# Altium schematic sheet 1.DSP.SchDoc
size A3; Date: 21/11/16; Author: DaiJun; Revision: 2.0; SheetNumber: 1; SheetTotal: 4; Size: A4; Contact: 0731-88731029
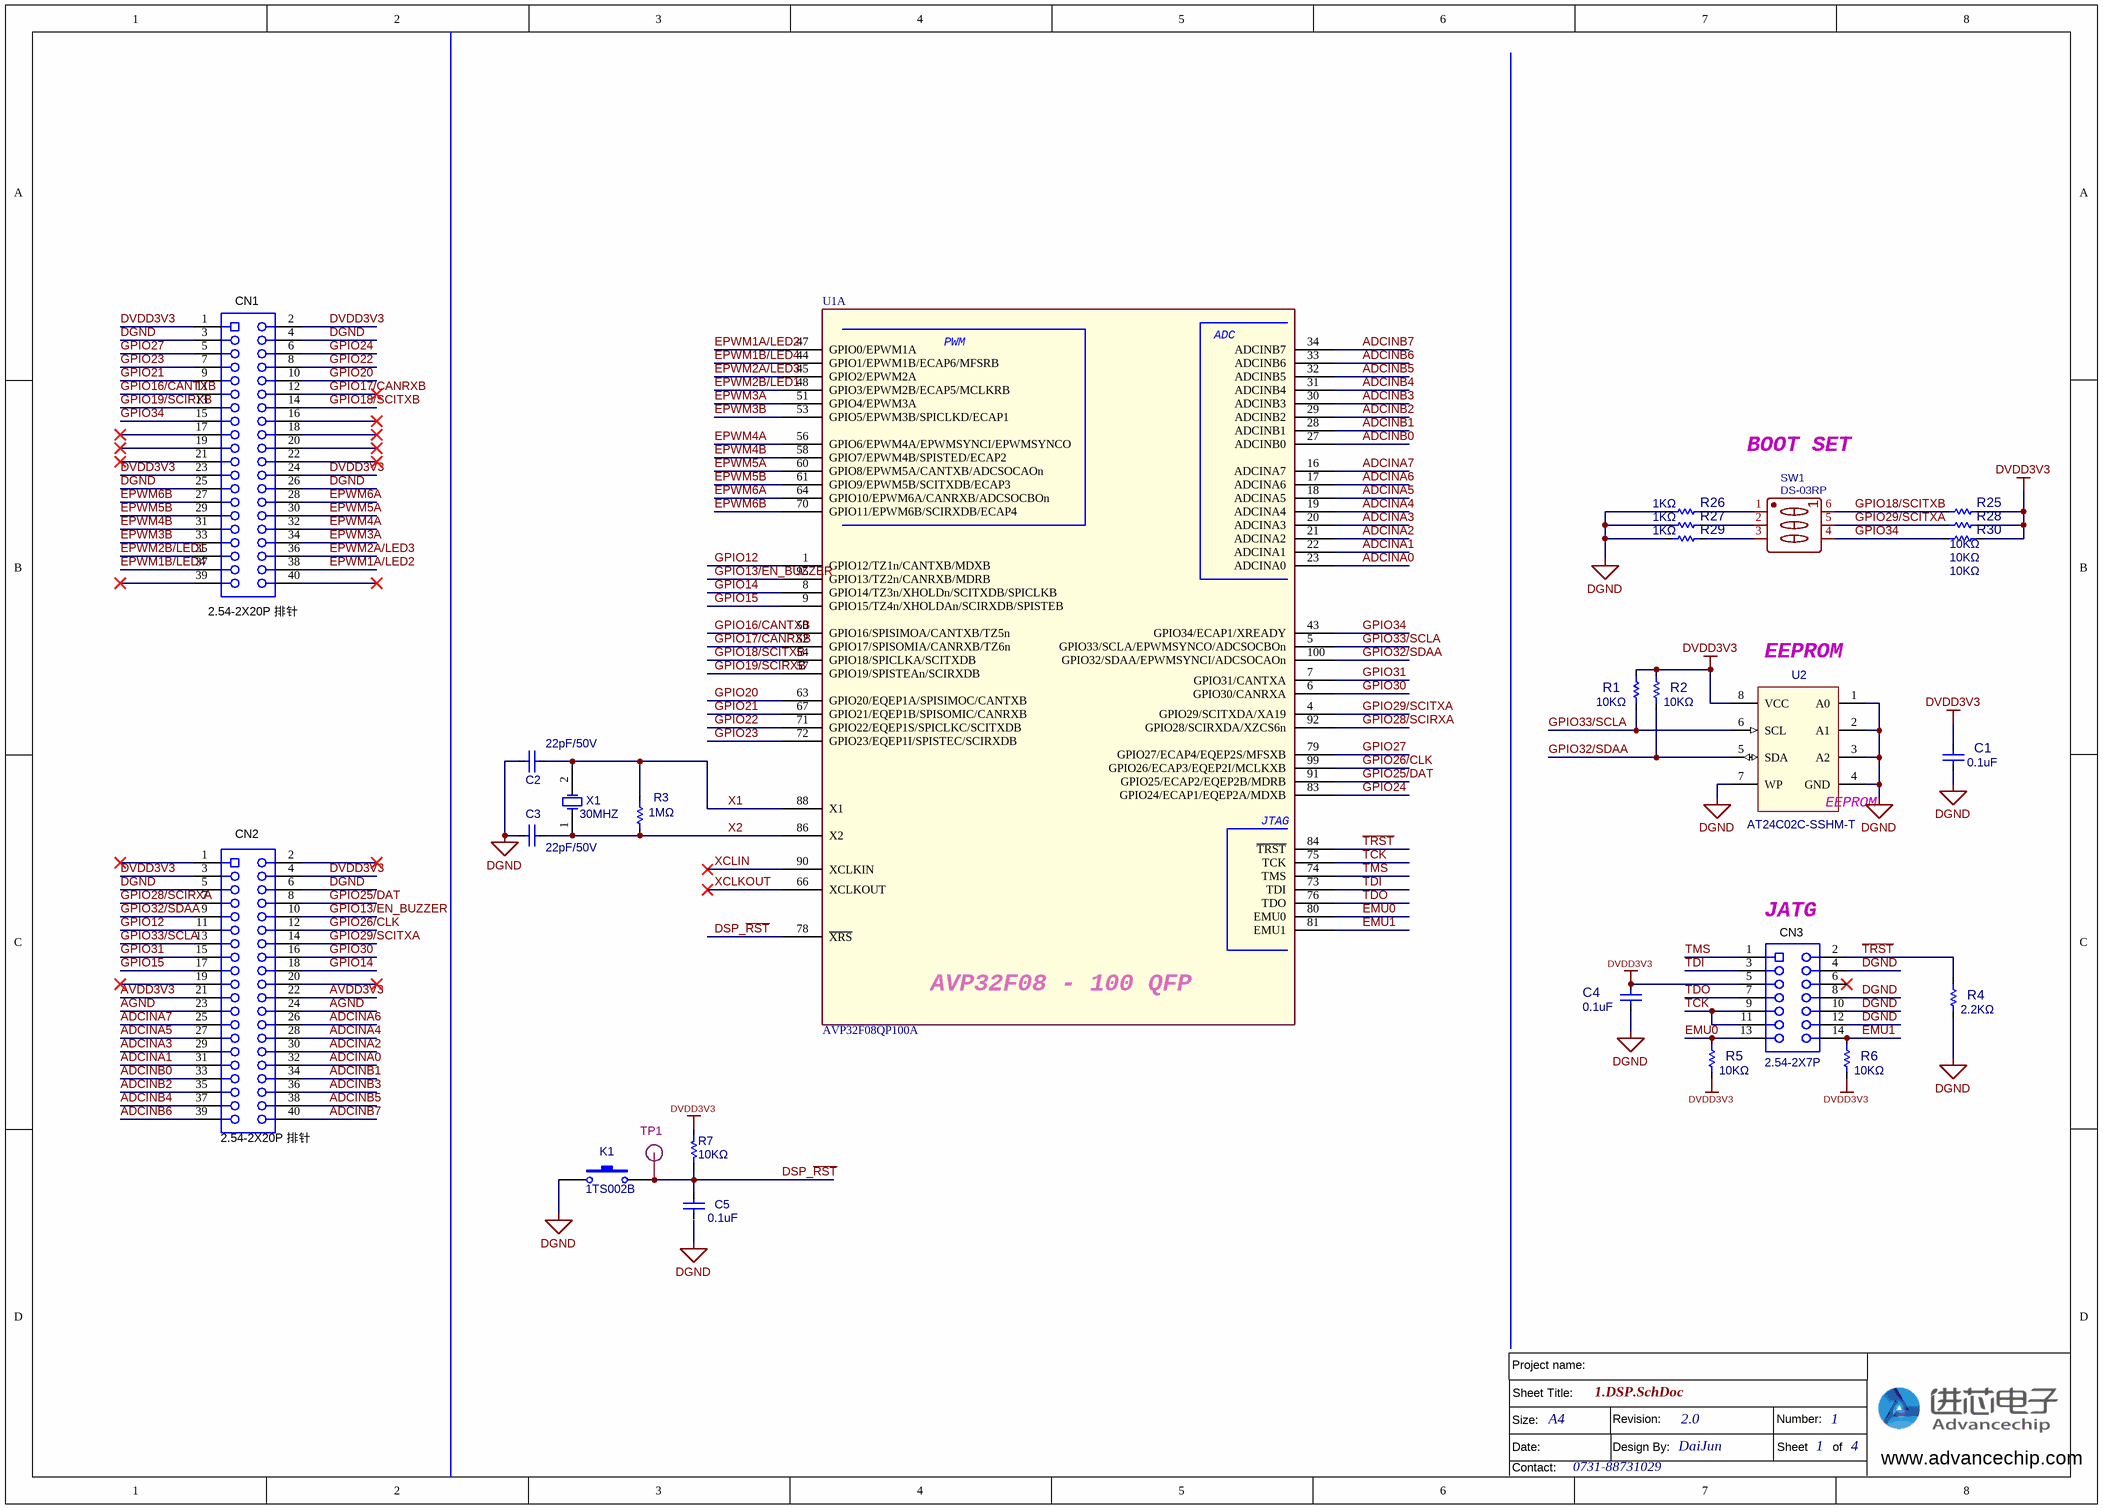
[diagram p0: 1.DSP.SchDoc]

## Parts
C1  value 0.1uF  [0603CX]  (hidden comment: 0.1uF/50V)
C2  22pF/50V  [0603cx]
C3  22pF/50V  [0603CX]
C4  value 0.1uF  [0603CX]  (hidden comment: 0.1uF/50V)
C5  value 0.1uF  [C0603]  (hidden comment: 0.1uF/50V)
CN1  2.54-2X20P 排针  [IDC2X20]
CN2  2.54-2X20P 排针  [IDC2X20]
CN3  value 2.54-2X7P  [IDC14-L]  (hidden comment: 2.54-2X7P 简易牛角母座)
K1  value 1TS002B  [SW-3X6]  (hidden comment: 1TS002B-2400-5001-CT)
R1  10KΩ  [0603RX]
R2  10KΩ  [0603RX]
R3  1MΩ  [0603RX]
R4  2.2KΩ  [0603RX]
R5  10KΩ  [0603RX]
R6  10KΩ  [0603RX]
R7  10KΩ  [R0603]
R25  10KΩ  [0603RX]
R26  1KΩ  [0603RX]
R27  1KΩ  [0603RX]
R28  10KΩ  [0603RX]
R29  1KΩ  [0603RX]
R30  10KΩ  [0603RX]
SW1  DS-03RP  [DS-03RP]
TP1  RST  [TEST-0.8/1.5MM]  (value not drawn)
U1  AVP32F08QP100A  [LQFP-100]  (part A of 2)
U2  AT24C02C-SSHM-T  [SO-8]
X1  value 30MHZ  [XTAL_5032]  (hidden comment: X503230MSB2GI)

## Nets
DGND: C1.2 C2.2 C3.1 C4.2 CN1.3 CN1.4 CN1.25 CN1.26 CN2.5 CN2.6 CN3.4 CN3.8 CN3.10 CN3.12 K1.2 R4.1 R26.2 R27.2 R29.2 U2.1(A0) U2.2(A1) U2.3(A2) U2.4(GND) U2.7(WP)
DVDD3V3: C1.1 C4.1 CN1.1 CN1.2 CN1.23 CN1.24 CN2.3 CN2.4 CN3.5 R1.2 R2.2 R5.1 R6.1 R7.1 R25.1 R28.1 R30.1 U2.8(VCC)
ADCINA0: CN2.32 U1.23(ADCINA0)
ADCINA1: CN2.31 U1.22(ADCINA1)
ADCINA2: CN2.30 U1.21(ADCINA2)
ADCINA3: CN2.29 U1.20(ADCINA3)
ADCINA4: CN2.28 U1.19(ADCINA4)
ADCINA5: CN2.27 U1.18(ADCINA5)
ADCINA6: CN2.26 U1.17(ADCINA6)
ADCINA7: CN2.25 U1.16(ADCINA7)
ADCINB0: CN2.33 U1.27(ADCINB0)
ADCINB1: CN2.34 U1.28(ADCINB1)
ADCINB2: CN2.35 U1.29(ADCINB2)
ADCINB3: CN2.36 U1.30(ADCINB3)
ADCINB4: CN2.37 U1.31(ADCINB4)
ADCINB5: CN2.38 U1.32(ADCINB5)
ADCINB6: CN2.39 U1.33(ADCINB6)
ADCINB7: CN2.40 U1.34(ADCINB7)
AGND: CN2.23 CN2.24
AVDD3V3: CN2.21 CN2.22
DSP_~{RST}: C5.1 K1.1 R7.2 TP1.1 U1.78(~{XRS})
EMU0: CN3.13 R5.2 U1.80(EMU0)
EMU1: CN3.14 R6.2 U1.81(EMU1)
EPWM1A/LED2: CN1.38 U1.47(GPIO0/EPWM1A)
EPWM1B/LED4: CN1.37 U1.44(GPIO1/EPWM1B/ECAP6/MFSRB)
EPWM2A/LED3: CN1.36 U1.45(GPIO2/EPWM2A)
EPWM2B/LED1: CN1.35 U1.48(GPIO3/EPWM2B/ECAP5/MCLKRB)
EPWM3A: CN1.34 U1.51(GPIO4/EPWM3A)
EPWM3B: CN1.33 U1.53(GPIO5/EPWM3B/SPICLKD/ECAP1)
EPWM4A: CN1.32 U1.56(GPIO6/EPWM4A/EPWMSYNCI/EPWMSYNCO)
EPWM4B: CN1.31 U1.58(GPIO7/EPWM4B/SPISTED/ECAP2)
EPWM5A: CN1.30 U1.60(GPIO8/EPWM5A/CANTXB/ADCSOCAOn)
EPWM5B: CN1.29 U1.61(GPIO9/EPWM5B/SCITXDB/ECAP3)
EPWM6A: CN1.28 U1.64(GPIO10/EPWM6A/CANRXB/ADCSOCBOn)
EPWM6B: CN1.27 U1.70(GPIO11/EPWM6B/SCIRXDB/ECAP4)
GPIO12: CN2.11 U1.1(GPIO12/TZ1n/CANTXB/MDXB)
GPIO13/EN_BUZZER: CN2.10 U1.95(GPIO13/TZ2n/CANRXB/MDRB)
GPIO14: CN2.18 U1.8(GPIO14/TZ3n/XHOLDn/SCITXDB/SPICLKB)
GPIO15: CN2.17 U1.9(GPIO15/TZ4n/XHOLDAn/SCIRXDB/SPISTEB)
GPIO16/CANTXB: CN1.11 U1.50(GPIO16/SPISIMOA/CANTXB/TZ5n)
GPIO17/CANRXB: CN1.12 U1.52(GPIO17/SPISOMIA/CANRXB/TZ6n)
GPIO18/SCITXB: CN1.14 R25.2 SW1.6(PIN6) U1.54(GPIO18/SPICLKA/SCITXDB)
GPIO19/SCIRXB: CN1.13 U1.57(GPIO19/SPISTEAn/SCIRXDB)
GPIO20: CN1.10 U1.63(GPIO20/EQEP1A/SPISIMOC/CANTXB)
GPIO21: CN1.9 U1.67(GPIO21/EQEP1B/SPISOMIC/CANRXB)
GPIO22: CN1.8 U1.71(GPIO22/EQEP1S/SPICLKC/SCITXDB)
GPIO23: CN1.7 U1.72(GPIO23/EQEP1I/SPISTEC/SCIRXDB)
GPIO24: CN1.6 U1.83(GPIO24/ECAP1/EQEP2A/MDXB)
GPIO25/DAT: CN2.8 U1.91(GPIO25/ECAP2/EQEP2B/MDRB)
GPIO26/CLK: CN2.12 U1.99(GPIO26/ECAP3/EQEP2I/MCLKXB)
GPIO27: CN1.5 U1.79(GPIO27/ECAP4/EQEP2S/MFSXB)
GPIO28/SCIRXA: CN2.7 U1.92(GPIO28/SCIRXDA/XZCS6n)
GPIO29/SCITXA: CN2.14 R28.2 SW1.5(PIN5) U1.4(GPIO29/SCITXDA/XA19)
GPIO30: CN2.16 U1.6(GPIO30/CANRXA)
GPIO31: CN2.15 U1.7(GPIO31/CANTXA)
GPIO32/SDAA: CN2.9 R2.1 U1.100(GPIO32/SDAA/EPWMSYNCI/ADCSOCAOn) U2.5(SDA)
GPIO33/SCLA: CN2.13 R1.1 U1.5(GPIO33/SCLA/EPWMSYNCO/ADCSOCBOn) U2.6(SCL)
GPIO34: CN1.15 R30.2 SW1.4(PIN4) U1.43(GPIO34/ECAP1/XREADY)
~{TRST}: CN3.2 R4.2 U1.84(~{TRST})
TCK: CN3.9 CN3.11 U1.75(TCK)
TDI: CN3.3 U1.73(TDI)
TDO: CN3.7 U1.76(TDO)
TMS: CN3.1 U1.74(TMS)
X1: C2.1 R3.1 U1.88(X1) X1.2(OSC2)
X2: C3.2 R3.2 U1.86(X2) X1.1(OSC1)
XCLIN: U1.90(XCLKIN)
XCLKOUT: U1.66(XCLKOUT)
NetR26_1: R26.1 SW1.1(PIN1)
NetR27_1: R27.1 SW1.2(PIN2)
NetR29_1: R29.1 SW1.3(PIN3)

Not connected (* = marked no-connect by the designer): C5 2; CN1 16* 17* 18* 19* 20* 21* 22* 39* 40*; CN2 1* 2* 19* 20*; CN3 6*

## Notes on the sheet
- BOOT SET
- (near U2) EEPROM
- (near CN3) JATG
- Sheet Title:
- Project name:
- Size:
- Date:
- Contact:
- Revision:
- Design By:
- Number:
- Sheet       of
- www.advancechip.com
- (in symbol AT24C02C) EEPROM
- (in symbol AVP32F08QP100, part A) ADC; PWM; JTAG; AVP32F08 - 100 QFP

## Library data of the parts
C1 C4 C5 = Cap: 贴片电容; Published: 8-Jun-2000; LatestRevisionDate: 17-Jul-2002; LatestRevisionNote: Re-released for DXP Platform.; Publisher: Altium Limited
C2 C3 = Cap: COG贴片电容; Value: 100pF; Published: 8-Jun-2000; LatestRevisionDate: 17-Jul-2002; LatestRevisionNote: Re-released for DXP Platform.; Publisher: Altium Limited
CN1 CN2 = CON 20X2A: 连接器
CN3 = Receptacle_7X2: 连接器
K1 = SW-PB: 鸿源精密轻触开关3X6; Published: 24-Mar-1999; LatestRevisionDate: 17-Jul-2002; LatestRevisionNote: Re-released for DXP Platform.; Publisher: Altium Limited
R1-R7 R25-R30 = Res: 贴片电阻; Value: 1K; Published: 8-Jun-2000; LatestRevisionDate: 17-Jul-2002; LatestRevisionNote: Re-released for DXP Platform.; Publisher: Altium Limited
SW1 = DS-03RP_C458086: BOM_Manufacturer: Korean Hroparts Elec; Contributor: LCSC; BOM_Supplier: LCSC; BOM_Supplier Part: C458086; BOM_Manufacturer Part: DS-03RP; BOM_JLCPCB Part Class: Extended Part; spicePre: S; spiceSymbolName: DS-03RP_C458086
TP1 = TP: 测试点
U1 = AVP32F08QP100: 进芯32位DSP
U2 = AT24C02C: EEPROM存储器
X1 = XTAL: 5032贴片无源晶振 30MHZ; Published: 8-Jun-2000; LatestRevisionDate: 17-Jul-2002; LatestRevisionNote: Re-released for DXP Platform.; Supply: https://item.szlcsc.com/113796.html